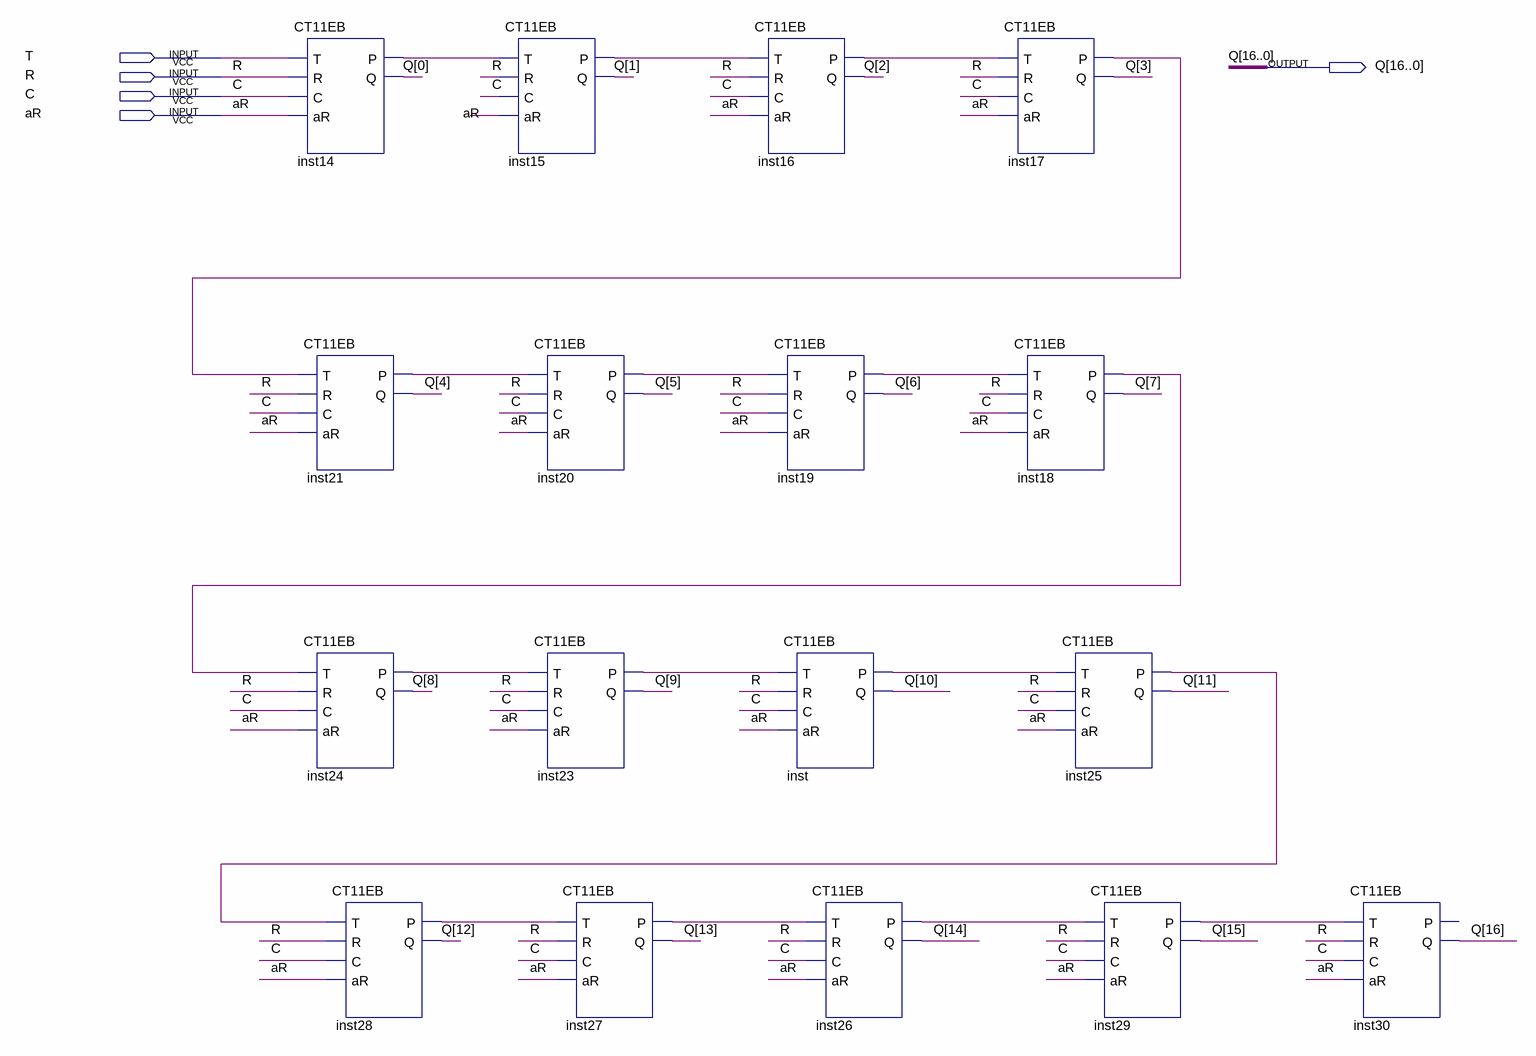
[diagram p0: schematic sheet]
// Quartus schematic CNT17.bdf as structural Verilog: 17 symbols, 5 pins
module CNT17 (
  input  T,
  input  R,
  input  C,
  input  aR,
  output [16:0] Q
);

  wire inst14_p, inst15_p, inst16_p, inst17_p, inst18_p, inst19_p, inst20_p, inst21_p, inst23_p, inst24_p,
       inst25_p, inst26_p, inst27_p, inst28_p, inst29_p, inst_p;

  CT11EB inst14 (.T(T), .R(R), .C(C), .aR(aR), .P(inst14_p), .Q(Q[0]));
  CT11EB inst21 (.T(inst17_p), .R(R), .C(C), .aR(aR), .P(inst21_p), .Q(Q[4]));
  CT11EB inst24 (.T(inst18_p), .R(R), .C(C), .aR(aR), .P(inst24_p), .Q(Q[8]));
  CT11EB inst28 (.T(inst25_p), .R(R), .C(C), .aR(aR), .P(inst28_p), .Q(Q[12]));
  CT11EB inst15 (.T(inst14_p), .R(R), .C(C), .aR(aR), .P(inst15_p), .Q(Q[1]));
  CT11EB inst20 (.T(inst21_p), .R(R), .C(C), .aR(aR), .P(inst20_p), .Q(Q[5]));
  CT11EB inst23 (.T(inst24_p), .R(R), .C(C), .aR(aR), .P(inst23_p), .Q(Q[9]));
  CT11EB inst27 (.T(inst28_p), .R(R), .C(C), .aR(aR), .P(inst27_p), .Q(Q[13]));
  CT11EB inst16 (.T(inst15_p), .R(R), .C(C), .aR(aR), .P(inst16_p), .Q(Q[2]));
  CT11EB inst19 (.T(inst20_p), .R(R), .C(C), .aR(aR), .P(inst19_p), .Q(Q[6]));
  CT11EB inst (.T(inst23_p), .R(R), .C(C), .aR(aR), .P(inst_p), .Q(Q[10]));
  CT11EB inst26 (.T(inst27_p), .R(R), .C(C), .aR(aR), .P(inst26_p), .Q(Q[14]));
  CT11EB inst17 (.T(inst16_p), .R(R), .C(C), .aR(aR), .P(inst17_p), .Q(Q[3]));
  CT11EB inst18 (.T(inst19_p), .R(R), .C(C), .aR(aR), .P(inst18_p), .Q(Q[7]));
  CT11EB inst25 (.T(inst_p), .R(R), .C(C), .aR(aR), .P(inst25_p), .Q(Q[11]));
  CT11EB inst29 (.T(inst26_p), .R(R), .C(C), .aR(aR), .P(inst29_p), .Q(Q[15]));
  CT11EB inst30 (.T(inst29_p), .R(R), .C(C), .aR(aR), .Q(Q[16]));  // open: P
endmodule
